# Altium schematic sheet 05_Peripherals.SchDoc
size A3; SheetNumber: 5; SheetTotal: 6
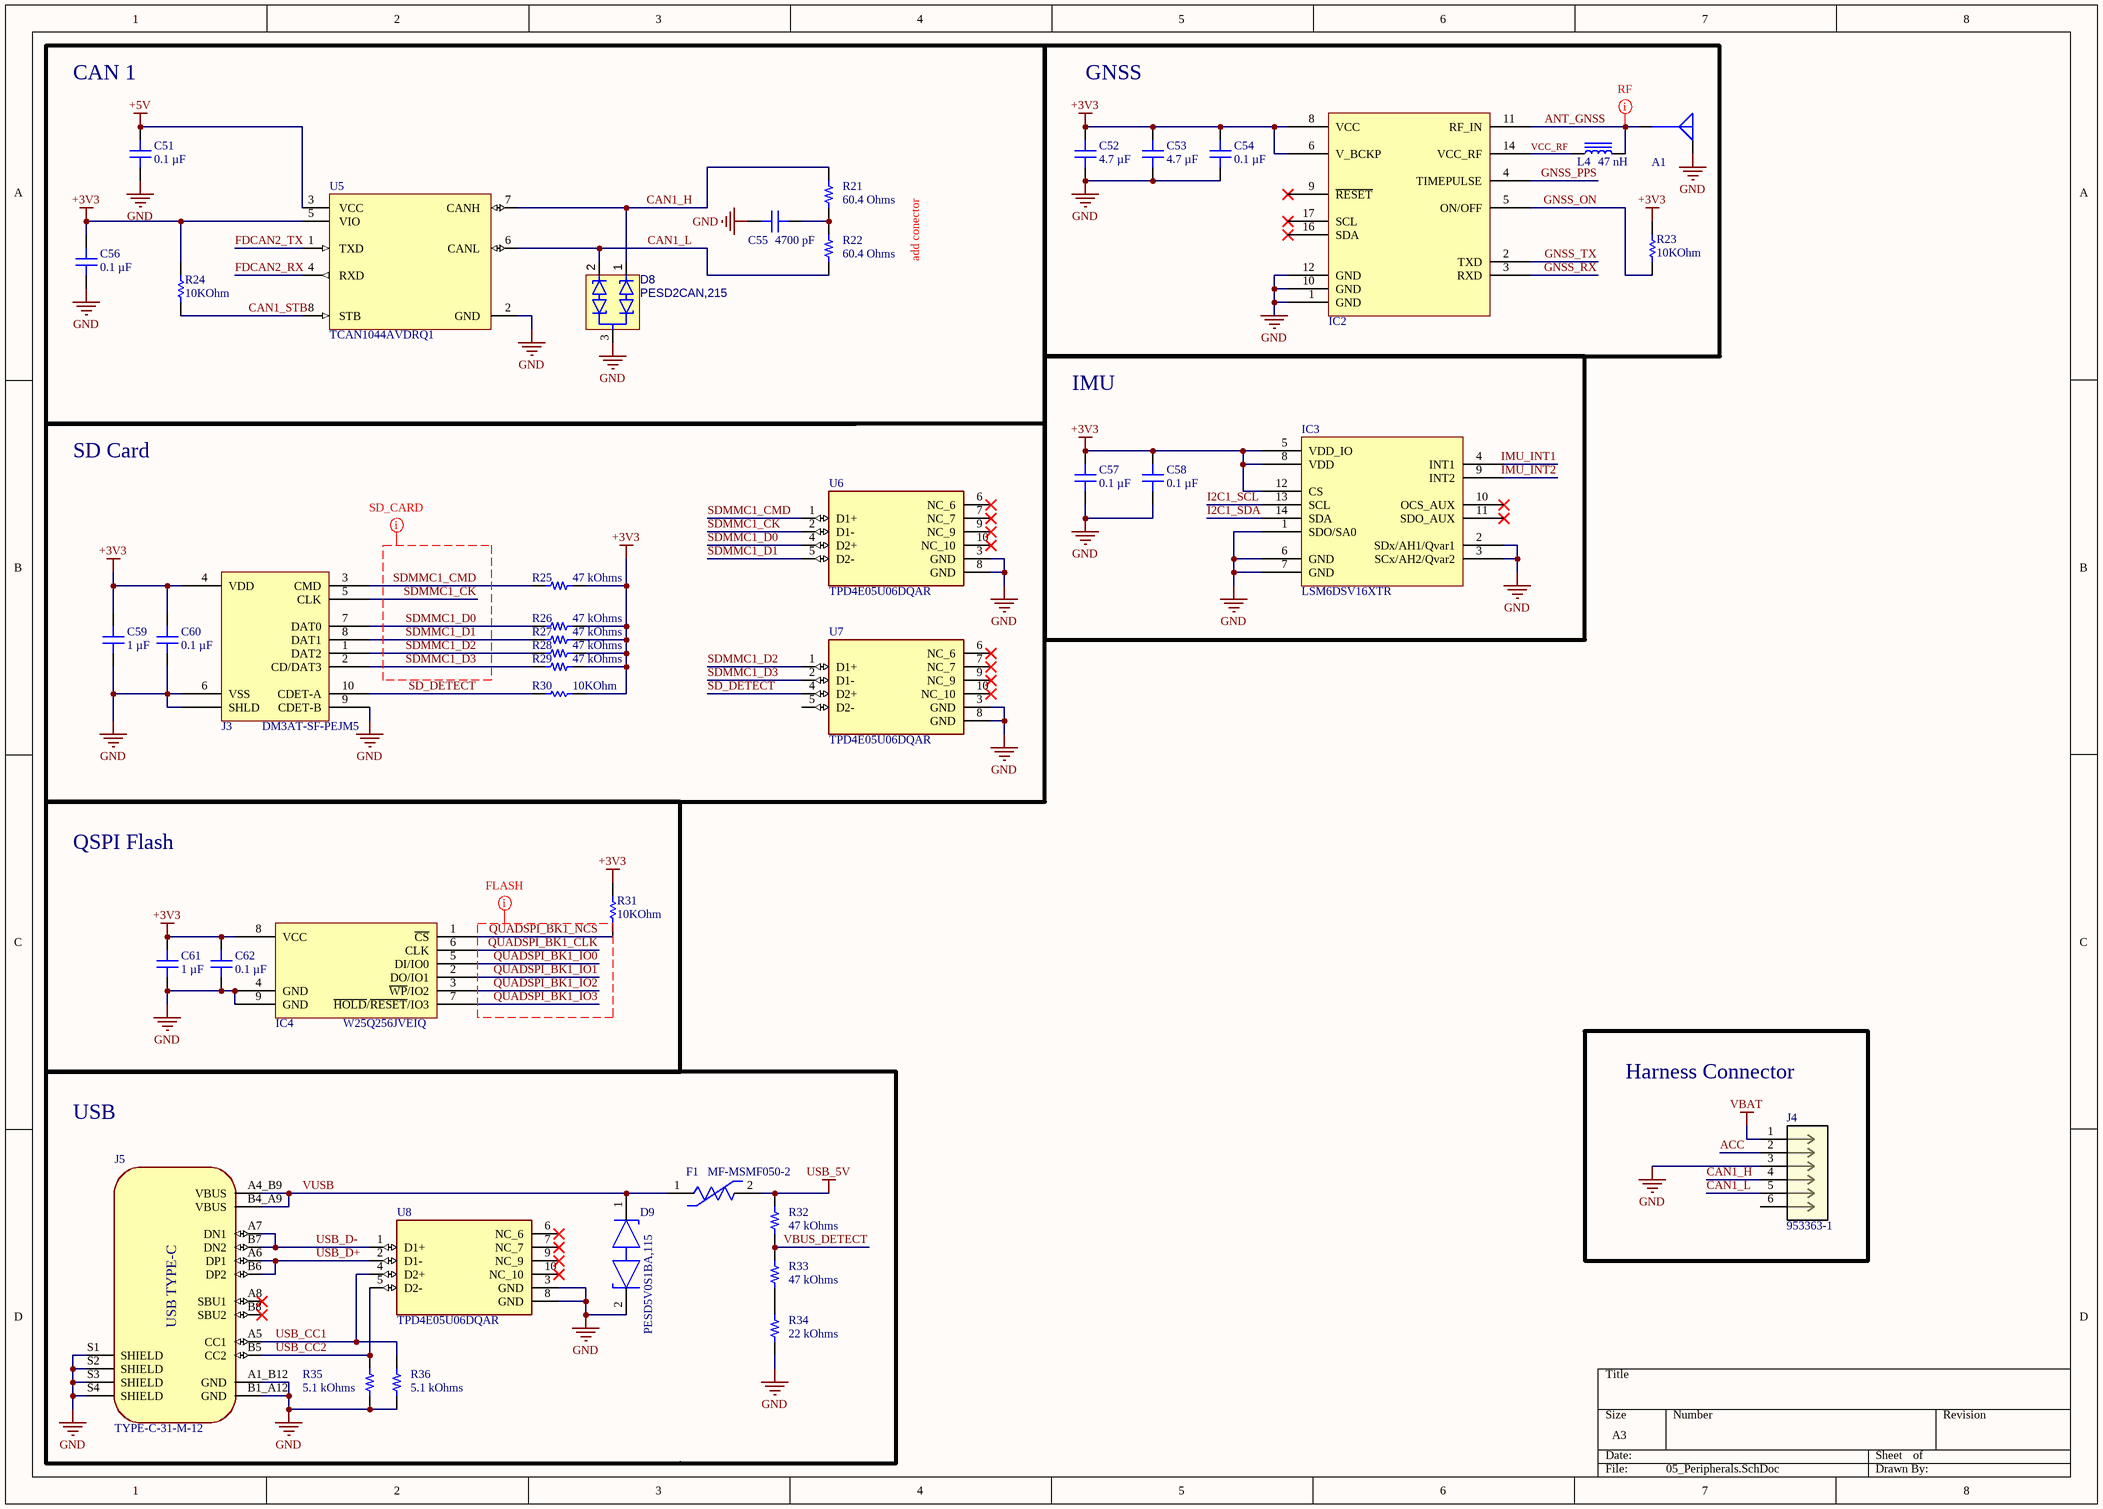
[diagram p0: 05_Peripherals.SchDoc]

## Parts
A1  1909763-1  [TE C-1909763]  (value not drawn)
C51  0.1 µF  [CAP 0402_1005]
C52  4.7 µF  [CAP 0603_1608]
C53  4.7 µF  [CAP 0603_1608]
C54  0.1 µF  [CAP 0402_1005]
C55  4700 pF  [CAP 0402_1005]
C56  0.1 µF  [CAP 0402_1005]
C57  0.1 µF  [CAP 0402_1005]
C58  0.1 µF  [CAP 0402_1005]
C59  1 µF  [CAP 0603_1608]
C60  0.1 µF  [CAP 0402_1005]
C61  1 µF  [CAP 0603_1608]
C62  0.1 µF  [CAP 0402_1005]
D8  PESD2CAN,215  [SOT95P230X110-3N]
D9  PESD5V0S1BA,115  [FP-SOD323-CA-MFG]
F1  MF-MSMF050-2  [FP-MF-MSMF050-2-MFG]
IC2  ATGM336H-5N  [U-BLOX MAX-8Q]  (value not drawn)
IC3  LSM6DSV16XTR  [STM LGA-14L 2.5x3.0MM]
IC4  W25Q256JVEIQ  [WINBOND WSON-8 8x6MM E]
J3  DM3AT-SF-PEJM5  [HIROSE DM3AT-SF-PEJM5]
J4  953363-1  [CONN6_953363-1_TEC]
J5  TYPE-C-31-M-12  [HRO_TYPE-C-31-M-12]
L4  47 nH  [IND 0402_1005 RF WW]
R21  60.4 Ohms  [RES 0603_1608]
R22  60.4 Ohms  [RES 0603_1608]
R23  10KOhm  [RESC1005X40X25LL05T05]
R24  10KOhm  [RESC1005X40X25LL05T05]
R25  47 kOhms  [RES 0402_1005]
R26  47 kOhms  [RES 0402_1005]
R27  47 kOhms  [RES 0402_1005]
R28  47 kOhms  [RES 0402_1005]
R29  47 kOhms  [RES 0402_1005]
R30  10KOhm  [RESC1005X40X25LL05T05]
R31  10KOhm  [RESC1005X40X25LL05T05]
R32  47 kOhms  [RES 0402_1005]
R33  47 kOhms  [RES 0402_1005]
R34  22 kOhms  [RES 0402_1005]
R35  5.1 kOhms  [RES 0402_1005]
R36  5.1 kOhms  [RES 0402_1005]
U5  TCAN1044AVDRQ1  [D0008A_MFG]
U6  TPD4E05U06DQAR  [IC_TPD4E05U06DQAR]
U7  TPD4E05U06DQAR  [IC_TPD4E05U06DQAR]
U8  TPD4E05U06DQAR  [IC_TPD4E05U06DQAR]

## Blocks framed on the sheet
GNSS: A1 C52-C54 IC2 L4 R23
IMU: C57 C58 IC3
SD Card: C59 C60 J3 R25-R30 U6 U7
QSPI Flash: C61 C62 IC4 R31
Harness Connector: J4
USB: D9 F1 J5 R32-R36 U8

## Nets
+3V3: C52.2 C53.2 C54.2 C56.2 C57.2 C58.2 C59.2 C60.2 C61.2 C62.2 IC2.6(V_BCKP) IC2.8(VCC) IC3.5(VDD_IO) IC3.8(VDD) IC3.12(CS) IC4.8(VCC) J3.4(VDD) R23.1 R24.1 R25.1 R26.1 R27.1 R28.1 R29.1 R30.1 R31.1 U5.5(VIO)
+5V: C51.2 U5.3(VCC)
GND: A1.G C51.1 C52.1 C53.1 C54.1 C55.1 C56.1 C57.1 C58.1 C59.1 C60.1 C61.1 C62.1 D8.3 D9.2(K2) IC2.1(GND) IC2.10(GND) IC2.12(GND) IC3.1(SDO/SA0) IC3.2(SDx/AH1/Qvar1) IC3.3(SCx/AH2/Qvar2) IC3.6(GND) IC3.7(GND) IC4.4(GND) IC4.9(GND) J3.6(VSS) J3.9(CDET-B) J3.S(SHLD) J4.3 J5.A1_B12(GND) J5.B1_A12(GND) J5.S1(SHIELD) J5.S2(SHIELD) J5.S3(SHIELD) J5.S4(SHIELD) R34.1 R35.1 R36.1 U5.2(GND) U6.3(GND) U6.8(GND) U7.3(GND) U7.8(GND) U8.3(GND) U8.8(GND)
USB_5V: F1.2 R32.2
VBAT: J4.1
ACC: J4.2
ANT_GNSS: A1.S IC2.11(RF_IN) L4.2
CAN1_H: D8.1 J4.4 R21.2 U5.7(CANH)
CAN1_L: D8.2 J4.5 R22.1 U5.6(CANL)
CAN1_STB: R24.2 U5.8(STB)
FDCAN2_RX: U5.4(RXD)
FDCAN2_TX: U5.1(TXD)
GNSS_ON: IC2.5(ON/OFF) R23.2
GNSS_PPS: IC2.4(TIMEPULSE)
GNSS_RX: IC2.3(RXD)
GNSS_TX: IC2.2(TXD)
I2C1_SCL: IC3.13(SCL)
I2C1_SDA: IC3.14(SDA)
IMU_INT1: IC3.4(INT1)
IMU_INT2: IC3.9(INT2)
QUADSPI_BK1_CLK: IC4.6(CLK)
QUADSPI_BK1_IO0: IC4.5(DI/IO0)
QUADSPI_BK1_IO1: IC4.2(DO/IO1)
QUADSPI_BK1_IO2: IC4.3(~{WP}/IO2)
QUADSPI_BK1_IO3: IC4.7(~{HOLD}/~{RESET}/IO3)
QUADSPI_BK1_NCS: IC4.1(~{CS}) R31.2
SD_DETECT: J3.10(CDET-A) R30.2 U7.4(D2+)
SDMMC1_CK: J3.5(CLK) U6.2(D1-)
SDMMC1_CMD: J3.3(CMD) R25.2 U6.1(D1+)
SDMMC1_D0: J3.7(DAT0) R26.2 U6.4(D2+)
SDMMC1_D1: J3.8(DAT1) R27.2 U6.5(D2-)
SDMMC1_D2: J3.1(DAT2) R28.2 U7.1(D1+)
SDMMC1_D3: J3.2(CD/DAT3) R29.2 U7.2(D1-)
USB_CC1: J5.A5(CC1) R36.2 U8.4(D2+)
USB_CC2: J5.B5(CC2) R35.2 U8.5(D2-)
USB_D+: J5.A6(DP1) J5.B6(DP2) U8.2(D1-)
USB_D-: J5.A7(DN1) J5.B7(DN2) U8.1(D1+)
VBUS_DETECT: R32.1 R33.2
VCC_RF: IC2.14(VCC_RF) L4.1
VUSB: D9.1(K1) F1.1 J5.A4_B9(VBUS) J5.B4_A9(VBUS)
NetC55_2: C55.2 R21.1 R22.2
NetR33_1: R33.1 R34.2

Not connected (* = marked no-connect by the designer): IC2 9(~{RESET})* 16(SDA)* 17(SCL)*; IC3 10(OCS_AUX)* 11(SDO_AUX)*; J4 6; J5 A8(SBU1)* B8(SBU2)*; U6 6(NC_6)* 7(NC_7)* 9(NC_9)* 10(NC_10)*; U7 5(D2-) 6(NC_6)* 7(NC_7)* 9(NC_9)* 10(NC_10)*; U8 6(NC_6)* 7(NC_7)* 9(NC_9)* 10(NC_10)*

## Layout directives
mark named SD_CARD: SDMMC1_CK, SDMMC1_CMD, SDMMC1_D0, SDMMC1_D1, SDMMC1_D2, SDMMC1_D3
mark named FLASH: QUADSPI_BK1_CLK, QUADSPI_BK1_IO0, QUADSPI_BK1_IO1, QUADSPI_BK1_IO2, QUADSPI_BK1_IO3, QUADSPI_BK1_NCS
net class RF: ANT_GNSS

## Notes on the sheet
- CAN 1
- add conector
- (in symbol TYPE-C-31-M-12) USB TYPE-C

## Library data of the parts
A1 = 1909763-1: CONN UMCC JACK STR 50OHM SMD; Manufacturer: TE Connectivity AMP Connectors; id: 12; Contact Termination: Solder; Connector Type: Jack, Male Pin; Number Of Ports: 1; Connector Style: U.FL (UMCC); Frequency - Max: 6 GHz; Part Number: 1909763-1; Housing Color: Ivory; Supplier Part Number 1: A118077CT-ND; ComponentLink1Description: Datasheet; ComponentLink2URL: https://www.digikey.com/en/products/detail/te-connectivity-amp-connectors/1909763-1/4731728; ComponentLink1URL: https://www.te.com/commerce/DocumentDelivery/DDEController?Action=srchrtrv&DocNm=1909763&DocType=Customer+Drawing&DocLang=English; Fastening Type: Snap-On; Supplier 1: DigiKey; Series: -; Part Status: Active; Shield Termination: Solder; ComponentLink2Description: DigiKey Link; Packaging: TapeAndReel; Minimum Order: 1; Lifecycle Status: Active; LastUpdated: 2022-06-29T18:17:07.053; Mounting Type: Surface Mount; Impedance: 50Ohm; Price: 0.23
C51 C54 C56-C58 C60 C62 = CL05B104KO5NNNC: CAP CER 0.1UF 16V X7R 0402; Manufacturer: Samsung Electro-Mechanics; id: 1479; Tolerance: ±10%; Part Number: CL05B104KO5NNNC; Value: 0.1 µF; Temperature Coefficient: X7R; Supplier Part Number 1: 1276-1001-1-ND; ComponentLink2Description: DigiKey Link; ComponentLink1URL: http://www.samsungsem.com/kr/support/product-search/mlcc/CL05B104KO5NNNC.jsp; PartId: 6066; Supplier 1: DigiKey; Series: CL; LastUpdated: 2023-01-03T20:04:06.380; Part Status: Active; Capacitance: 0.1 µF; Device Package: 0402 (1005 Metric); Thickness (Max): 0.022" (0.55mm); Voltage - Rated: 16V; Minimum Order: 1; Packaging: CutTape; Applications: General Purpose; Package / Case: 0402 (1005 Metric); ComponentLink1Description: Datasheet; Price: 0.01; ComponentLink2URL: https://www.digikey.com/en/products/detail/samsung-electro-mechanics/CL05B104KO5NNNC/3886659; Lifecycle Status: Active; Operating Temperature: -55°C ~ 125°C; Size / Dimension: 0.039" L x 0.020" W (1.00mm x 0.50mm); Mounting Type: Surface Mount, MLCC
C52 C53 = CL10A475KP8NNNC: CAP CER 4.7UF 10V X5R 0603; Manufacturer: Samsung Electro-Mechanics; id: 830; Tolerance: ±10%; Part Number: CL10A475KP8NNNC; Value: 4.7 µF; Temperature Coefficient: X5R; Supplier Part Number 1: 1276-1044-1-ND; ComponentLink2Description: DigiKey Link; ComponentLink1URL: http://www.samsungsem.com/kr/support/product-search/mlcc/CL10A475KP8NNNC.jsp; PartId: 5671; Supplier 1: DigiKey; Series: CL; LastUpdated: 2023-01-03T20:07:38.840; Part Status: Active; Capacitance: 4.7 µF; Device Package: 0603 (1608 Metric); Thickness (Max): 0.035" (0.90mm); Voltage - Rated: 10V; Minimum Order: 1; Packaging: TapeAndReel; Applications: General Purpose; Package / Case: 0603 (1608 Metric); ComponentLink1Description: Datasheet; Price: 0.01; ComponentLink2URL: https://www.digikey.com/en/products/detail/samsung-electro-mechanics/CL10A475KP8NNNC/3886702; Lifecycle Status: Active; Operating Temperature: -55°C ~ 85°C; Size / Dimension: 0.063" L x 0.031" W (1.60mm x 0.80mm); Mounting Type: Surface Mount, MLCC
C55 = C0402C472K4RECAUTO: CAP CER 0402 4.7NF 16V X7R 10%; Manufacturer: KEMET; id: 3032; Part Number: C0402C472K4RECAUTO; Value: 4700 pF; Temperature Coefficient: X7R; Supplier Part Number 1: 399-17875-1-ND; ComponentLink2Description: DigiKey Link; ComponentLink1URL: https://api.kemet.com/component-edge/download/datasheet/C0402C472K4RECAUTO.pdf; PartId: 12122; Tolerance: ±10%; Supplier 1: DigiKey; Series: ESD SMD Auto X7R; LastUpdated: 2023-01-03T20:03:46.940; Part Status: Active; Capacitance: 4700 pF; Device Package: 0402 (1005 Metric); Ratings: AEC-Q200; Thickness (Max): 0.022" (0.55mm); Voltage - Rated: 16V; Minimum Order: 1; Packaging: TapeAndReel; Applications: Automotive, ESD Protection; Package / Case: 0402 (1005 Metric); ComponentLink1Description: Datasheet; Price: 0.01; ComponentLink2URL: https://www.digikey.com/en/products/detail/kemet/C0402C472K4RECAUTO/8640469; Lifecycle Status: Active; Operating Temperature: -55°C ~ 125°C; Size / Dimension: 0.039" L x 0.020" W (1.00mm x 0.50mm); Mounting Type: Surface Mount, MLCC
C59 C61 = C0603C105K4RACAUTO: CAP CER 1UF 16V X7R 0603; Manufacturer: KEMET; id: 14; Tolerance: ±10%; Part Number: C0603C105K4RACAUTO; Value: 1 µF; Temperature Coefficient: X7R; Supplier Part Number 1: 399-17704-2-ND; ComponentLink2Description: DigiKey Link; ComponentLink1URL: https://api.kemet.com/component-edge/download/datasheet/C0603C105K4RACAUTO.pdf; PartId: 2179; Supplier 1: DigiKey; Series: SMD Auto X7R; LastUpdated: 2023-01-03T20:07:48.393; Part Status: Active; Capacitance: 1 µF; Device Package: 0603 (1608 Metric); Ratings: AEC-Q200; Thickness (Max): 0.037" (0.95mm); Voltage - Rated: 16V; Minimum Order: 0; Applications: Automotive, Bypass, Decoupling; Package / Case: 0603 (1608 Metric); ComponentLink1Description: Datasheet; Price: 0; ComponentLink2URL: https://www.digikey.com/en/products/detail/kemet/C0603C105K4RACAUTO/8635831; Lifecycle Status: Active; Operating Temperature: -55°C ~ 125°C; Size / Dimension: 0.063" L x 0.031" W (1.60mm x 0.80mm); Mounting Type: Surface Mount, MLCC
D8 = CMP-004-00031-1: 5A 230W 41V 26.2V Bidirectional 24V SOT-23 ESD and Surge Protection (TVS/ESD) ROHS; Manufacturer Lifecycle Status: RELEASED FOR SUPPLY; Element Configuration: Dual; Peak Reverse Current: 10nA; Power Line Protection: No; Number of Bidirectional Channels: 2; Leakage Current: 50nA; Breakdown Voltage: 28V; Number of Channels: 1; Value: 17pF; ESD Protection: Yes; Max Breakdown Voltage: 30.3V; Max Junction Temperature (Tj): 150°C; Test Current: 1mA; Pins: 3; Composition: Zener; Case/Package: SOT-23; Width: 1.4mm; China RoHS: Compliant; Ratings: AEC-Q101; Depth: 1.4mm; Max Operating Temperature: 150°C; Clamping Voltage: 41V; Min Breakdown Voltage: 26.2V; Termination: SMD/SMT; Peak Pulse Power: 230W; Peak Pulse Current: 5A; Height: 1.1mm; Contact Plating: Tin; Min Operating Temperature: -55°C; Mounting Technology: Surface Mount; Ambient Temperature Range High: 150°C; RoHS: Compliant; Max Reverse Leakage Current: 10nA; Reverse Breakdown Voltage: 26.2V; Number of Terminals: 3; Reverse Standoff Voltage: 24V; Polarity: Bidirectional; Schedule B: 8541100050, 8541100050; REACH SVHC: Unaffected; Length: 3mm; Number of Elements: 1; Working Voltage: 24V; Max Surge Current: 5A; Operating Supply Voltage: 24V; Radiation Hardening: No; Lead Free: Lead Free; Max Power Dissipation: 230W; Direction: Bidirectional; Weight: 4.535924g; Lifecycle Status: Production
D9 = CMP-14432-000001-1: TVS DIODE 5V 14V SOD323
F1 = CMP-2100-03653-2: PTC RESET FUSE 15V 500MA 1812; Manufacturer: Bourns; Value: 0.15-1Ω; Trip Current: 1A; Automotive Grade: Grade 3; Trip Time: 0.15s; Current Rating: 100A; Hold Current: 0.5A; Height: 0.85mm; Package: 1812; Voltage Rating: 15V; Temperature Range High: +85°C; Device Class L2: PTC Resettable Fuses; Lead Free: Yes; ComponentLink2URL: http://www.bourns.com/docs/Product-Datasheets/mfmsmf.pdf; Ambient Temperature Range High: +85°C; Mouser Description: PTC Resettable Fuse 0.5A(hold) 1A(trip) 15V 100A 0.8W 0.15s 0.15Ohm SMD Solder Pad 1812 T/R; Digikey Description: PTC RESET FUSE 15V 500MA 1812; Manufacturer Part Number: MF-MSMF050-2; Resistance: 0.15-1Ω; Category: Fuse; ComponentLink2Description: Datasheet; Automotive: Yes; Temperature Range Low: -40°C; RoHS: TRUE; Device Class L1: Circuit Protection; Temperature: -40°C to +85°C; Octopart: https://octopart.com/mf-msmf050-2-bourns-28047; Ambient Temperature Range Low: -40°C; Device Class L3: unset
IC2 = ATGM336H-5N: RF RX GLONASS/GNSS/GPS 1.575GHZ; id: 1; Voltage - Supply: 2.7V ~ 3.6V; Data Interface: I²C, UART; Part Number: ATGM336H-5N; ComponentLink1Description: Datasheet; ComponentLink1URL: https://github.com/YahboomTechnology/GPS_Module/blob/main/1.GPS%20module%20information/ATGM336H-5N%20Datasheet_EN.pdf; Series: ATGM336H-5N
IC3 = STM LSM6DSV16X: INEMO 3D ACCELEROMETER AND 3D GY; Manufacturer: STMicroelectronics; id: 1; Output Type: I2C, SPI; Sensor Type: Accelerometer, Gyroscope, Temperature, 6 Axis; Part Number: LSM6DSV16XTR; ComponentLink2URL: https://www.digikey.com/en/products/detail/stmicroelectronics/LSM6DSV16XTR/16841485; Price: 2.76; Supplier 1: DigiKey; ComponentLink1Description: Datasheet; ComponentLink2Description: DigiKey Link; Minimum Order: 1; Supplier Part Number 1: 497-LSM6DSV16XTRCT-ND; Operating Temperature: -40°C ~ 85°C; Mounting Type: Surface Mount; Supplier Device Package: 14-LGA (2.5x3); ComponentLink1URL: https://www.st.com/content/ccc/resource/technical/document/datasheet/group3/47/03/b2/44/47/32/4b/76/DM00741844/files/DM00741844.pdf/jcr:content/translations/en.DM00741844.pdf; Packaging: TapeAndReel; Series: -; LastUpdated: 2026-02-04T10:16:47.433; Lifecycle Status: Active
IC4 = W25Q256JVEIQ: IC FLASH 256MBIT SPI/QUAD 8WSON; Manufacturer: Winbond Electronics; id: 620; Memory Size: 256Mb (32M x 8); Voltage - Supply: 2.7V ~ 3.6V; Write Cycle Time - Word, Page: 3ms; Memory Type: Non-Volatile; Clock Frequency: 133 MHz; Memory Interface: SPI - Quad I/O; Part Number: W25Q256JVEIQ; Supplier Part Number 1: W25Q256JVEIQ-ND; Supplier Device Package: 8-WSON (8x6); ComponentLink1Description: Datasheet; Memory Format: FLASH; ComponentLink2URL: https://www.digikey.com/en/products/detail/winbond-electronics/W25Q256JVEIQ/6810681; ComponentLink1URL: http://www.winbond.com/resource-files/w25q256jv%20spi%20revg%2008032017.pdf; Supplier 1: DigiKey; Series: SpiFlash®; Part Status: Active; ComponentLink2Description: DigiKey Link; Packaging: Tube; Minimum Order: 1; Package / Case: 8-WDFN Exposed Pad; PartId: 1453; Lifecycle Status: Active; LastUpdated: 2024-08-29T14:07:08.517; Technology: FLASH - NOR; Operating Temperature: -40°C ~ 85°C (TA); Mounting Type: Surface Mount; Price: 2.50
J3 = DM3AT-SF-PEJM5: CONN MICRO SD CARD PUSH-PUSH R/A; Manufacturer: Hirose Electric Co Ltd; id: 1; Connector Type: Connector and Ejector; Number Of Positions: 10 (8 + 2); Insertion, Removal Method: Push In, Push Out; Card Type: Secure Digital - microSD™; Part Number: DM3AT-SF-PEJM5; Height Above Board: 0.066" (1.68mm); Supplier Part Number 1: HR1964TR-ND; ComponentLink1Description: Datasheet; ComponentLink2URL: //digikey.com/product-detail/en/hirose-electric-co-ltd/DM3AT-SF-PEJM5/HR1964TR-ND/2533565; Features: Switch; ComponentLink1URL: https://www.hirose.com/product/document?clcode=CL0609-0033-6-00&productname=DM3AT-SF-PEJ2M5&series=DM3&documenttype=Catalog&lang=en&documentid=D49662_en; Mounting Feature: Normal, Standard - Top; Supplier 1: DigiKey; Series: DM3; Part Status: Active; ComponentLink2Description: DigiKey Link; Packaging: TapeAndReel; Minimum Order: 1; Contact Finish: Gold; Lifecycle Status: 0; LastUpdated: 2019-12-16T20:34:40.023; Mounting Type: Surface Mount, Right Angle; Price: 1.41
J4 = 953363-1: 6pos MQS .63 header 180deg; Manufacturer_Name: TE Connectivity; TYPE: -; Copyright: Copyright (C) 2026 Ultra Librarian. All rights reserved.; Manufacturer_Part_Number: 953363-1; Datasheet: https://www.te.com/commerce/DocumentDelivery/DDEController?Action=srchrtrv&DocNm=108-15199&DocType=Specification+Or+Standard&DocLang=English&PartCntxt=953363-3&DocFormat=pdf; RefDes: RefDes
J5 = TYPE-C-31-M-12: USB Connectors 24 Receptacle 1 8.94*7.3mm RoHS; MF: HRO Electronics Co., Ltd.; SnapEDA_Link: https://www.snapeda.com/parts/TYPE-C-31-M-12/HRO+Electronics+Co.%252C+Ltd./view-part/?ref=snap; Package: Package; Value: *; MP: TYPE-C-31-M-12; Check_prices: https://www.snapeda.com/parts/TYPE-C-31-M-12/HRO+Electronics+Co.%252C+Ltd./view-part/?ref=eda
L4 = LQW15AN47NJ00D: FIXED IND 47NH 210MA 1.08OHM SMD; Manufacturer: Murata Electronics; id: 266; Frequency - Self Resonant: 2.9GHz; Tolerance: ±5%; Type: Wirewound; Inductance Frequency - Test: 100 MHz; Q @ Freq: 25 @ 200MHz; Material - Core: Non-Magnetic; DC Resistance (DCR): 1.08Ohm Max; Shielding: Unshielded; Part Number: LQW15AN47NJ00D; Height - Seated (Max): 0.024" (0.60mm); Supplier Part Number 1: 490-1154-1-ND; Current Rating (Amps): 210 mA; Inductance: 47 nH; ComponentLink1Description: Datasheet; ComponentLink2URL: https://www.digikey.com/en/products/detail/murata-electronics/LQW15AN47NJ00D/584363; ComponentLink1URL: https://search.murata.co.jp/Ceramy/image/img/P02/JELF243A-0050.pdf; Supplier 1: DigiKey; Series: LQW15; Part Status: Active; ComponentLink2Description: DigiKey Link; Device Package: 0402 (1005 Metric); Packaging: TapeAndReel; Minimum Order: 1; Package / Case: 0402 (1005 Metric); PartId: 266; Lifecycle Status: Active; LastUpdated: 2023-01-02T20:59:31.513; Operating Temperature: -55°C ~ 125°C; Value: 47 nH; Size / Dimension: 0.039" L x 0.020" W (1.00mm x 0.50mm); Mounting Type: Surface Mount; Price: 0.05
R21 R22 = ERJ-PA3F60R4V: RES SMD 60.4 OHM 1% 1/3W 0603; Manufacturer: Panasonic Electronic Components; id: 21330; Temperature Coefficient: ±100ppm/°C; Power (Watts): 0.333W, 1/3W; Part Number: ERJ-PA3F60R4V; Height - Seated (Max): 0.022" (0.55mm); Supplier Part Number 1: 10-ERJ-PA3F60R4VCT-ND; Supplier Device Package: 0603; ComponentLink1Description: Datasheet; ComponentLink2URL: https://www.digikey.com/en/products/detail/panasonic-electronic-components/ERJ-PA3F60R4V/5037768; Features: Automotive AEC-Q200, Pulse Withstanding; ComponentLink1URL: https://industrial.panasonic.com/cdbs/www-data/pdf/RDO0000/AOA0000C331.pdf; Composition: Thick Film; Tolerance: ±1%; Supplier 1: DigiKey; Series: ERJ-PA3; ComponentLink2Description: DigiKey Link; Device Package: 0603 (1608 Metric); Packaging: TapeAndReel; Ratings: AEC-Q200; Minimum Order: 1; Package / Case: 0603 (1608 Metric); PartId: 82262; Lifecycle Status: Active; LastUpdated: 2023-10-29T19:35:03.690; Operating Temperature: -55°C ~ 155°C; Number Of Terminations: 2; Value: 60.4 Ohms; Size / Dimension: 0.063" L x 0.031" W (1.60mm x 0.80mm); Price: 0.01; Resistance: 60.4 Ohms
R23 R24 R30 R31 = CMP-2000-07588-1: Chip Resistor, 10 KOhm, +/- 1%, 0.1 W, -55 to 155 degC, 0402 (1005 Metric), RoHS, Tape and Reel; Manufacturer: Panasonic; Power Rating: 100mW; Voltage Rating: 50V; Case\/Package: 0402; Temperature Coefficient: 100ppm\/degreesC; RoHSCompliant: True; Lead Free: LeadFree; Package Quantity: 1; Contact Plating: Tin; Resistance: 10KOhm; Length: 1mm; Radiation Hardening: No; REACH SVHC: NoSVHC; Max Operating Temperature: 155degC; Depth: 0.5mm; Case Code (Imperial): 0402; Military Standard: Not; Package Description: 2-Pin Surface Mount Device, Body 1 x 0.5 mm; Termination: SMD/SMT; Case Code (Metric): 1005; Height: 0.35mm; Packaging: TapeandReel; Voltage Rating (DC): 50V; Package Reference: 402; Number of Pins: 2; Tolerance: 1%; Mounting Technology: SurfaceMount; Width: 0.02inch; Mount: SurfaceMount; Datasheet URL: https://industrial.panasonic.com/cdbs/www-data/pdf/RDA0000/AOA0000C304.pdf; Composition: ThickFilm; Datasheet Version: 02/2017; Manufacturer URL: http://www.panasonic.com/; Max Power Dissipation: 100mW; Number of Terminations: 2; Min Operating Temperature: -55degC
R25-R29 = RC0402FR-0747KL: RES 47K OHM 1% 1/16W 0402; Manufacturer: Yageo; id: 9309; Temperature Coefficient: ±100ppm/°C; Power (Watts): 0.063W, 1/16W; Part Number: RC0402FR-0747KL; Height - Seated (Max): 0.016" (0.40mm); Supplier Part Number 1: 311-47.0KLRCT-ND; Supplier Device Package: 0402; ComponentLink1Description: Datasheet; ComponentLink2URL: https://www.digikey.com/en/products/detail/yageo/RC0402FR-0747KL/726616; Features: Moisture Resistant; ComponentLink1URL: https://www.yageo.com/upload/media/product/productsearch/datasheet/rchip/PYu-RC_Group_51_RoHS_L_10.pdf; Composition: Thick Film; Tolerance: ±1%; Supplier 1: DigiKey; Series: RC_L; Part Status: Active; ComponentLink2Description: DigiKey Link; Device Package: 0402 (1005 Metric); Packaging: CutTape; Minimum Order: 1; Package / Case: 0402 (1005 Metric); PartId: 20550; Lifecycle Status: Active; LastUpdated: 2023-01-02T20:20:32.550; Operating Temperature: -55°C ~ 155°C; Number Of Terminations: 2; Value: 47 kOhms; Size / Dimension: 0.039" L x 0.020" W (1.00mm x 0.50mm); Price: 0.01; Resistance: 47 kOhms
R32 R33 = RMCF0402FT47K0: RES 47K OHM 1% 1/16W 0402; Manufacturer: Stackpole Electronics Inc; id: 1346; Temperature Coefficient: ±100ppm/°C; Power (Watts): 0.063W, 1/16W; Part Number: RMCF0402FT47K0; Height - Seated (Max): 0.016" (0.40mm); Supplier Part Number 1: RMCF0402FT47K0CT-ND; Supplier Device Package: 0402; ComponentLink1Description: Datasheet; ComponentLink2URL: https://www.digikey.com/en/products/detail/stackpole-electronics-inc/RMCF0402FT47K0/1714749; Features: Automotive AEC-Q200; ComponentLink1URL: https://www.seielect.com/catalog/sei-rmcf_rmcp.pdf; Composition: Thick Film; Tolerance: ±1%; Supplier 1: DigiKey; Series: RMCF; Part Status: Active; ComponentLink2Description: DigiKey Link; Device Package: 0402 (1005 Metric); Packaging: CutTape; Ratings: AEC-Q200; Minimum Order: 1; Package / Case: 0402 (1005 Metric); PartId: 4957; Lifecycle Status: Active; LastUpdated: 2023-01-02T20:21:41.127; Operating Temperature: -55°C ~ 155°C; Number Of Terminations: 2; Value: 47 kOhms; Size / Dimension: 0.039" L x 0.020" W (1.00mm x 0.50mm); Price: 0.01; Resistance: 47 kOhms
R34 = RT0402BRD0722KL: RES SMD 22K OHM 0.1% 1/16W 0402; Manufacturer: Yageo; id: 1014; Temperature Coefficient: ±25ppm/°C; Power (Watts): 0.063W, 1/16W; Part Number: RT0402BRD0722KL; Height - Seated (Max): 0.014" (0.35mm); Supplier Part Number 1: YAG4210CT-ND; Supplier Device Package: 0402; ComponentLink1Description: Datasheet; ComponentLink2URL: https://www.digikey.com/en/products/detail/yageo/RT0402BRD0722KL/1069136; ComponentLink1URL: https://www.yageo.com/upload/media/product/productsearch/datasheet/rchip/PYu-RT_1-to-0.01_RoHS_L_11.pdf; Composition: Thin Film; Tolerance: ±0.1%; Supplier 1: DigiKey; Series: RT; Part Status: Active; ComponentLink2Description: DigiKey Link; Device Package: 0402 (1005 Metric); Packaging: TapeAndReel; Minimum Order: 1; Package / Case: 0402 (1005 Metric); PartId: 4575; Lifecycle Status: Active; LastUpdated: 2023-01-02T20:21:43.577; Operating Temperature: -55°C ~ 155°C; Number Of Terminations: 2; Value: 22 kOhms; Size / Dimension: 0.039" L x 0.020" W (1.00mm x 0.50mm); Price: 0.04; Resistance: 22 kOhms
R35 R36 = RT0402BRE075K1L: RES SMD 5.1K OHM 0.1% 1/16W 0402; Manufacturer: Yageo; id: 1029; Temperature Coefficient: ±50ppm/°C; Power (Watts): 0.063W, 1/16W; Part Number: RT0402BRE075K1L; Height - Seated (Max): 0.014" (0.35mm); Supplier Part Number 1: YAG4404CT-ND; Supplier Device Package: 0402; ComponentLink1Description: Datasheet; ComponentLink2URL: http://digikey.com/product-detail/en/yageo/RT0402BRE075K1L/YAG4404CT-ND/6616560; ComponentLink1URL: https://www.yageo.com/upload/media/product/productsearch/datasheet/rchip/PYu-RT_1-to-0.01_RoHS_L_11.pdf; Composition: Thin Film; Tolerance: ±0.1%; Supplier 1: DigiKey; Series: RT; Part Status: Active; ComponentLink2Description: DigiKey Link; Device Package: 0402 (1005 Metric); Packaging: TapeAndReel; Minimum Order: 1; Package / Case: 0402 (1005 Metric); PartId: 4590; Lifecycle Status: Active; LastUpdated: 2023-01-02T20:21:43.473; Operating Temperature: -55°C ~ 155°C; Number Of Terminations: 2; Value: 5.1 kOhms; Size / Dimension: 0.039" L x 0.020" W (1.00mm x 0.50mm); Price: 0.04; Resistance: 5.1 kOhms
U5 = CMP-00370-122305019-1: Enhanced automotive CAN transceiver with standby 8-SOIC -40 to 150; Manufacturer Lifecycle Status: ACTIVE; Height: 1.75mm; HelpURL: https://www.ti.com/lit/ds/symlink/tcan1044a-q1.pdf; Case/Package: SOIC; Number of Pins: 8; Lifecycle Status: Production; Thickness: 1.58mm; ComponentLink1URL: http://ti.com; RoHS: Compliant; Length: 4.9mm; ComponentLink2Description: Datasheet URL; Width: 3.91mm; ComponentLink2URL: https://www.ti.com/lit/ds/symlink/tcan1044a-q1.pdf; ComponentLink1Description: Manufacturer's Website
U6-U8 = TPD4E05U06DQAR: Quad 0.5-pF, 5.5-V, Â±12-kV ESD protection diode for USB, HDMI & High Speed Interfaces; MF: Texas Instruments; Value: *; SnapEDA_Link: https://www.snapeda.com/parts/TPD4E05U06DQAR/Texas+Instruments/view-part/?ref=snap; Purchase-URL: https://pricing.snapeda.com/search/part/TPD4E05U06DQAR/?ref=eda; Availability: In Stock; Price: None; Package: USON-10 Texas Instruments; Check_prices: https://www.snapeda.com/parts/TPD4E05U06DQAR/Texas+Instruments/view-part/?ref=eda; MP: TPD4E05U06DQAR